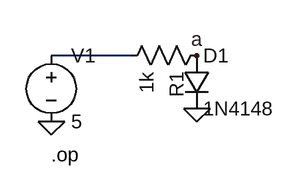
[diagram p0: schematic diode.asc]
diode.asc, the LTspice schematic file:
Version 4.1
SHEET 1 880 680
WIRE 96 16 0 16
FLAG 0 96 0
FLAG 176 80 0
FLAG 176 16 a
SYMBOL voltage 0 0 R0
SYMATTR InstName V1
SYMATTR Value 5
SYMBOL res 192 0 R90
SYMATTR InstName R1
SYMATTR Value 1k
SYMBOL diode 160 16 R0
SYMATTR InstName D1
SYMATTR Value 1N4148
TEXT 0 136 Left 2 !.op

The netlist it stands for:
* diode.asc
V1 N001 0 5
R1 a N001 1k
D1 a 0 1N4148
.model D D
.lib standard.dio
.op
.backanno
.end